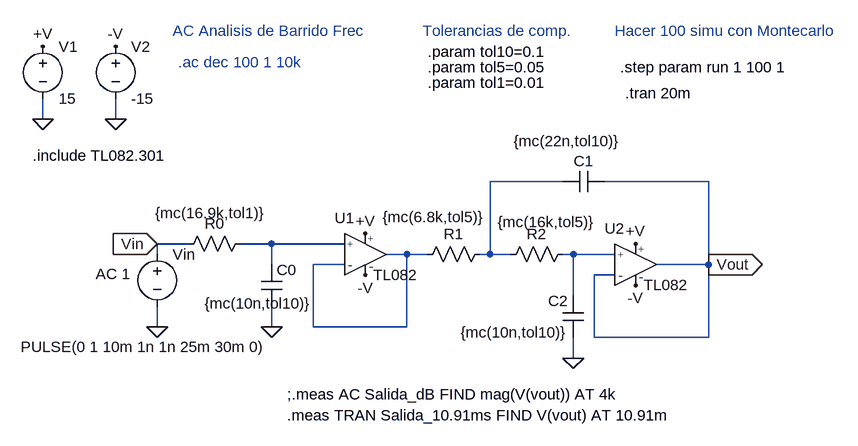
[diagram p0: schematic PasaBajos_Bessel_orden3_ModeloFabricante_Montecarlo.asc]
PasaBajos_Bessel_orden3_ModeloFabricante_Montecarlo.asc, the LTspice schematic file:
Version 4.1
SHEET 1 896 680
WIRE -352 -48 -352 -80
WIRE -240 -48 -240 -80
WIRE 448 48 336 48
WIRE 672 48 512 48
WIRE -128 144 -176 144
WIRE 0 144 -48 144
WIRE 112 144 0 144
WIRE -176 160 -176 144
WIRE 208 160 176 160
WIRE 240 160 208 160
WIRE 336 160 336 48
WIRE 336 160 320 160
WIRE 368 160 336 160
WIRE 464 160 448 160
WIRE 528 160 464 160
WIRE 0 176 0 144
WIRE 112 176 64 176
WIRE 672 176 672 48
WIRE 672 176 592 176
WIRE 528 192 496 192
WIRE 464 224 464 160
WIRE -176 272 -176 240
WIRE 0 272 0 240
WIRE 64 272 64 176
WIRE 208 272 208 160
WIRE 208 272 64 272
WIRE 496 288 496 192
WIRE 672 288 672 176
WIRE 672 288 496 288
WIRE 464 320 464 288
FLAG -352 -48 0
FLAG -240 -48 0
FLAG -352 -160 +V
FLAG 144 128 +V
FLAG 560 144 +V
FLAG -240 -160 -V
FLAG 144 192 -V
FLAG 560 208 -V
FLAG 0 272 0
FLAG 464 320 0
FLAG 672 176 Vout
IOPIN 672 176 Out
FLAG -176 272 0
FLAG -176 144 Vin
IOPIN -176 144 In
SYMBOL voltage -352 -176 R0
WINDOW 123 0 0 Left 0
WINDOW 39 0 0 Left 0
SYMATTR InstName V1
SYMATTR Value 15
SYMBOL voltage -240 -176 R0
WINDOW 123 0 0 Left 0
WINDOW 39 0 0 Left 0
SYMATTR InstName V2
SYMATTR Value -15
SYMBOL res -32 128 R90
WINDOW 0 0 56 VBottom 2
WINDOW 3 -47 62 VTop 2
SYMATTR InstName R0
SYMATTR Value {mc(16.9k,tol1)}
SYMBOL cap -16 176 R0
WINDOW 3 -87 60 Left 2
SYMATTR Value {mc(10n,tol10)}
SYMATTR InstName C0
SYMBOL res 336 144 R90
WINDOW 0 0 56 VBottom 2
WINDOW 3 -57 87 VTop 2
SYMATTR InstName R1
SYMATTR Value {mc(6.8k,tol5)}
SYMBOL res 464 144 R90
WINDOW 0 0 56 VBottom 2
WINDOW 3 -49 41 VTop 2
SYMATTR InstName R2
SYMATTR Value {mc(16k,tol5)}
SYMBOL cap 512 32 R90
WINDOW 0 0 32 VBottom 2
WINDOW 3 -62 57 VTop 2
SYMATTR InstName C1
SYMATTR Value {mc(22n,tol10)}
SYMBOL cap 480 288 R180
WINDOW 0 24 56 Left 2
WINDOW 3 24 8 Left 2
SYMATTR InstName C2
SYMATTR Value {mc(10n,tol10)}
SYMBOL voltage -176 144 R0
WINDOW 3 -210 159 Left 2
WINDOW 123 -95 46 Left 2
WINDOW 39 0 0 Left 0
SYMATTR Value PULSE(0 1 10m 1n 1n 25m 30m 0)
SYMATTR Value2 AC 1
SYMATTR InstName Vin
SYMBOL TL082 80 208 R0
SYMATTR InstName U1
SYMBOL TL082 496 224 R0
SYMATTR InstName U2
TEXT 544 -88 Left 2 !.tran 20m
TEXT -152 -184 Left 2 ;AC Analisis de Barrido Frec
TEXT -144 -136 Left 2 ;.ac dec 100 1 10k
TEXT 240 -128 Left 2 !.param tol5=0.05
TEXT 240 -104 Left 2 !.param tol1=0.01
TEXT 232 -184 Left 2 ;Tolerancias de comp.
TEXT 536 -128 Left 2 !.step param run 1 100 1
TEXT 528 -184 Left 2 ;Hacer 100 simu con Montecarlo
TEXT -368 8 Left 2 !.include TL082.301
TEXT 240 -152 Left 2 !.param tol10=0.1
TEXT 24 376 Left 2 !;.meas AC Salida_dB FIND mag(V(vout)) AT 4k
TEXT 24 408 Left 2 !.meas TRAN Salida_10.91ms FIND V(vout) AT 10.91m

The netlist it stands for:
* PasaBajos_Bessel_orden3_ModeloFabricante_Montecarlo.asc
V1 +V 0 15
V2 -V 0 -15
R0 N002 Vin {mc(16.9k,tol1)}
C0 N002 0 {mc(10n,tol10)}
R1 N001 N003 {mc(6.8k,tol5)}
R2 N004 N001 {mc(16k,tol5)}
C1 Vout N001 {mc(22n,tol10)}
C2 0 N004 {mc(10n,tol10)}
Vin Vin 0 PULSE(0 1 10m 1n 1n 25m 30m 0) AC 1
X§U1 N002 N003 +V -V N003 TL082  ; pins 1 2 3 4 5
X§U2 N004 Vout +V -V Vout TL082  ; pins 1 2 3 4 5
.tran 20m
* AC Analisis de Barrido Frec
* .ac dec 100 1 10k
.param tol5=0.05
.param tol1=0.01
* Tolerancias de comp.
.step param run 1 100 1
* Hacer 100 simu con Montecarlo
.include TL082.301
.param tol10=0.1
;.meas AC Salida_dB FIND mag(V(vout)) AT 4k
.meas TRAN Salida_10.91ms FIND V(vout) AT 10.91m
.lib TL082.301
.backanno
.end